# Altium schematic sheet SPSU_1.SchDoc: SPSU
size 292 x 217 mm; PCB_VERSION: V3.0; Origin: Eagle; Date: 12/02/2024 2:33:38 pm; SheetNumber: 2; SCHEMATIC_VERSION: SCHEMATIC_VERSION; GateName_1: G$1; SymbolName_1: A4L-LOC; LibraryName: frames_corvus; DeviceSetName: A4L-LOC; Sheet: Sheet:
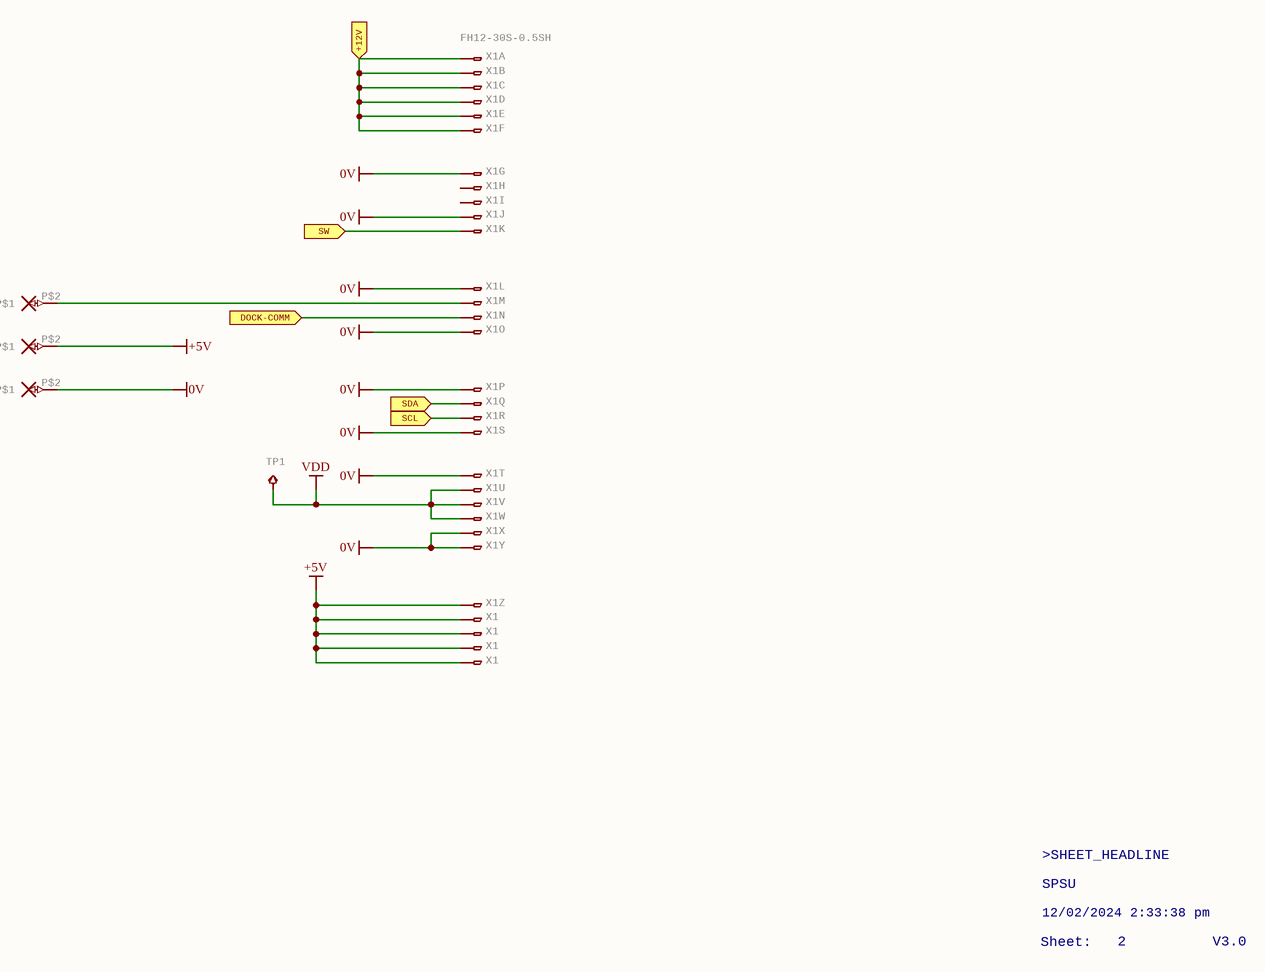
[diagram p0: SPSU_1.SchDoc]

## Parts
+  TH-0.75/0.6  [TH-0.75/0.6]  (value not drawn)
-  TH-0.75/0.6  [TH-0.75/0.6]  (value not drawn)
D  TH-0.75/0.6  [TH-0.75/0.6]  (value not drawn)
TP1  TPTP11R  [TP11R]  (value not drawn)
X1  FH12-30S-0.5SH  [FH12-30S-0.5SH]  (parts A,B,C,D,E,F,G,H,I,J,K,L,M,N,O,P,Q,R,S,T,U,V,W,X,Y,Z,27,28,29,30 of 30)

## Ports
+12V (in), DOCK-COMM (in), SCL (in), SDA (in), SW (in)

## Nets
0V: -.P$2(P$1) X1.7 X1.10 X1.12 X1.15 X1.16 X1.19 X1.20 X1.24 X1.25
+5V: +.P$2(P$1) X1.26 X1.27 X1.28 X1.29 X1.30
VDD: TP1.TP X1.21 X1.22 X1.23
+12V: X1.1 X1.2 X1.3 X1.4 X1.5 X1.6 ; port +12V
DOCK-COMM: X1.14 ; port DOCK-COMM
SCL: X1.18 ; port SCL
SDA: X1.17 ; port SDA
SW: X1.11 ; port SW
NetD_P$2: D.P$2(P$1) X1.13

Not connected (* = marked no-connect by the designer): X1 8(1) 9(1)

## Notes on the sheet
- >SHEET_HEADLINE
- Sheet:
- SPSU
- 12/02/2024 2:33:38 pm
- 2
- V3.0

## Library data of the parts
+ - D = TH-0.75/0.6: GateName_1: G$1; SymbolName_1: TH; LibraryName: corvus_holes; DeviceSetName: TH-0.75/0.6
TP1 = TPTP11R: GateName_1: G$1; SymbolName_1: TP; DeviceName: TP11R; LibraryName: corvus_holes; DeviceSetName: TP
X1 = FH12-30S-0.5SH: GateName_1: -1; SymbolName_1: PINV; GateName_2: -2; SymbolName_2: PIN; GateName_3: -3; GateName_4: -4; GateName_5: -5; GateName_6: -6; GateName_7: -7; GateName_8: -8; GateName_9: -9; GateName_10: -10; GateName_11: -11; GateName_12: -12; GateName_13: -13; GateName_14: -14; GateName_15: -15; GateName_16: -16; GateName_17: -17; GateName_18: -18; GateName_19: -19; GateName_20: -20; GateName_21: -21; GateName_22: -22; GateName_23: -23; GateName_24: -24; GateName_25: -25; GateName_26: -26; GateName_27: -27; GateName_28: -28; GateName_29: -29; GateName_30: -30; DeviceName: H; SymbolName_3: PIN; SymbolName_4: PIN; SymbolName_5: PIN; SymbolName_6: PIN; SymbolName_7: PIN; SymbolName_8: PIN; SymbolName_9: PIN; SymbolName_10: PIN; SymbolName_11: PIN; SymbolName_12: PIN; SymbolName_13: PIN; SymbolName_14: PIN; SymbolName_15: PIN; SymbolName_16: PIN; SymbolName_17: PIN; SymbolName_18: PIN; SymbolName_19: PIN; SymbolName_20: PIN; SymbolName_21: PIN; SymbolName_22: PIN; SymbolName_23: PIN; SymbolName_24: PIN; SymbolName_25: PIN; SymbolName_26: PIN; SymbolName_27: PIN; SymbolName_28: PIN; SymbolName_29: PIN; SymbolName_30: PIN; LibraryName: corvus_parts; DeviceSetName: FH12-30S-0.5S; FARNELL: 1324555